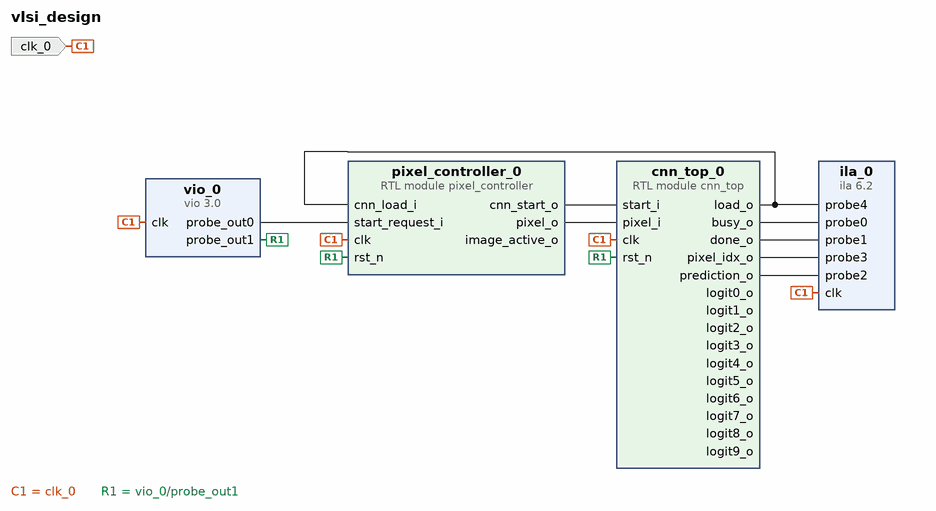
[diagram p0: block diagram of the top level]
# Vivado block design vlsi_design, xc7z020clg484-1, Vivado 2026.1
create_bd_design vlsi_design

create_bd_port -dir I -type clk clk_0

create_bd_cell -type ip -vlnv xilinx.com:ip:vio:3.0 vio_0
set_property -dict {CONFIG.C_NUM_PROBE_IN 0 CONFIG.C_NUM_PROBE_OUT 2} [get_bd_cells vio_0]
create_bd_cell -type ip -vlnv xilinx.com:ip:ila:6.2 ila_0
set_property -dict [list \
  CONFIG.C_DATA_DEPTH 1024 \
  CONFIG.C_MONITOR_TYPE Native \
  CONFIG.C_NUM_OF_PROBES 5 \
  CONFIG.C_PROBE0_WIDTH 1 \
  CONFIG.C_PROBE10_WIDTH 1 \
  CONFIG.C_PROBE11_WIDTH 1 \
  CONFIG.C_PROBE12_WIDTH 1 \
  CONFIG.C_PROBE13_WIDTH 1 \
  CONFIG.C_PROBE14_WIDTH 1 \
  CONFIG.C_PROBE15_WIDTH 1 \
  CONFIG.C_PROBE1_WIDTH 1 \
  CONFIG.C_PROBE2_WIDTH 4 \
  CONFIG.C_PROBE3_WIDTH 10 \
  CONFIG.C_PROBE4_WIDTH 1 \
  CONFIG.C_PROBE5_WIDTH 1 \
  CONFIG.C_PROBE7_WIDTH 1 \
  CONFIG.C_PROBE8_WIDTH 1 \
  CONFIG.C_PROBE9_WIDTH 1 \
] [get_bd_cells ila_0]
create_bd_cell -type module -reference cnn_top cnn_top_0
create_bd_cell -type module -reference pixel_controller pixel_controller_0

# ---- connections ----

connect_bd_net -net clk_0_1 [get_bd_ports clk_0] \
  [get_bd_pins vio_0/clk] [get_bd_pins ila_0/clk] [get_bd_pins pixel_controller_0/clk] [get_bd_pins cnn_top_0/clk]
connect_bd_net [get_bd_pins cnn_top_0/busy_o] [get_bd_pins ila_0/probe0]
connect_bd_net [get_bd_pins cnn_top_0/done_o] [get_bd_pins ila_0/probe1]
connect_bd_net [get_bd_pins cnn_top_0/load_o] [get_bd_pins ila_0/probe4] [get_bd_pins pixel_controller_0/cnn_load_i]
# net cnn_top_0_logit0_o has one end: cnn_top_0/logit0_o
# net cnn_top_0_logit1_o has one end: cnn_top_0/logit1_o
# net cnn_top_0_logit2_o has one end: cnn_top_0/logit2_o
# net cnn_top_0_logit3_o has one end: cnn_top_0/logit3_o
# net cnn_top_0_logit4_o has one end: cnn_top_0/logit4_o
# net cnn_top_0_logit5_o has one end: cnn_top_0/logit5_o
# net cnn_top_0_logit6_o has one end: cnn_top_0/logit6_o
# net cnn_top_0_logit7_o has one end: cnn_top_0/logit7_o
# net cnn_top_0_logit8_o has one end: cnn_top_0/logit8_o
# net cnn_top_0_logit9_o has one end: cnn_top_0/logit9_o
connect_bd_net [get_bd_pins cnn_top_0/pixel_idx_o] [get_bd_pins ila_0/probe3]
connect_bd_net [get_bd_pins cnn_top_0/prediction_o] [get_bd_pins ila_0/probe2]
connect_bd_net [get_bd_pins pixel_controller_0/cnn_start_o] [get_bd_pins cnn_top_0/start_i]
# net pixel_controller_0_image_active_o has one end: pixel_controller_0/image_active_o
connect_bd_net [get_bd_pins pixel_controller_0/pixel_o] [get_bd_pins cnn_top_0/pixel_i]
connect_bd_net [get_bd_pins vio_0/probe_out0] [get_bd_pins pixel_controller_0/start_request_i]
connect_bd_net [get_bd_pins vio_0/probe_out1] [get_bd_pins pixel_controller_0/rst_n] [get_bd_pins cnn_top_0/rst_n]

validate_bd_design
save_bd_design
